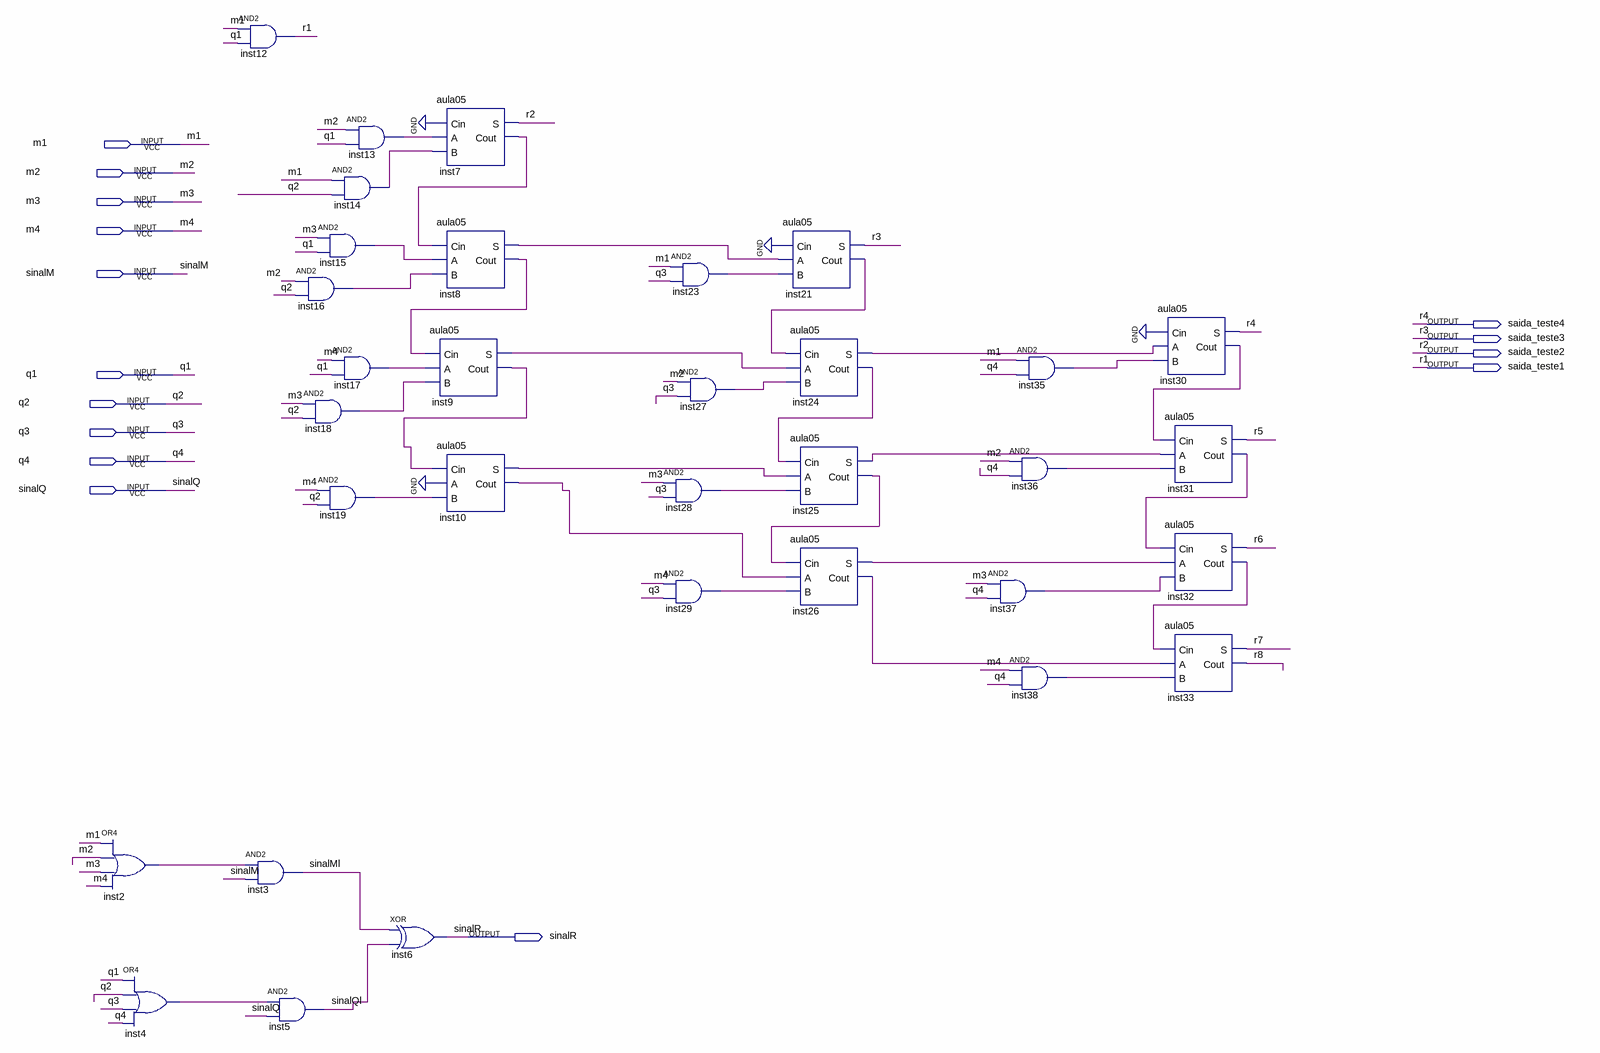
[diagram p0: schematic sheet]
// Quartus schematic aula10.bdf as structural Verilog: 33 symbols, 15 pins
module aula10 (
  input  m1,
  input  m2,
  input  m3,
  input  m4,
  input  sinalM,
  input  q1,
  input  q2,
  input  q3,
  input  q4,
  input  sinalQ,
  output saida_teste4,
  output saida_teste3,
  output saida_teste2,
  output saida_teste1,
  output sinalR
);

  wire inst2_out, inst4_out, inst7_cout, inst8_cout, inst8_s, inst9_cout, inst9_s, inst10_cout, inst10_s,
       inst13_out, inst14_out, inst15_out, inst16_out, inst17_out, inst18_out, inst19_out, inst21_cout,
       inst23_out, inst24_cout, inst24_s, inst25_cout, inst25_s, inst26_cout, inst26_s, inst27_out,
       inst28_out, inst29_out, inst30_cout, inst31_cout, inst32_cout, inst35_out, inst36_out, inst37_out,
       inst38_out, r5, r6, r7, r8, sinalMl, sinalQl;

  or inst2 (inst2_out, m1, m2, m3, m4);
  or inst4 (inst4_out, q1, q2, q3, q4);
  and inst12 (saida_teste1, m1, q1);
  and inst3 (sinalMl, inst2_out, sinalM);
  and inst5 (sinalQl, inst4_out, sinalQ);
  and inst13 (inst13_out, m2, q1);
  and inst14 (inst14_out, m1, q2);
  and inst15 (inst15_out, m3, q1);
  and inst16 (inst16_out, m2, q2);
  and inst17 (inst17_out, m4, q1);
  and inst18 (inst18_out, m3, q2);
  and inst19 (inst19_out, m4, q2);
  xor inst6 (sinalR, sinalMl, sinalQl);
  aula05 inst7 (.Cin(1'b0), .A(inst13_out), .B(inst14_out), .S(saida_teste2), .Cout(inst7_cout));
  aula05 inst8 (.Cin(inst7_cout), .A(inst15_out), .B(inst16_out), .S(inst8_s), .Cout(inst8_cout));
  aula05 inst9 (.Cin(inst8_cout), .A(inst17_out), .B(inst18_out), .S(inst9_s), .Cout(inst9_cout));
  aula05 inst10 (.Cin(inst9_cout), .A(1'b0), .B(inst19_out), .S(inst10_s), .Cout(inst10_cout));
  and inst23 (inst23_out, m1, q3);
  and inst27 (inst27_out, m2, q3);
  and inst28 (inst28_out, m3, q3);
  and inst29 (inst29_out, m4, q3);
  aula05 inst21 (.Cin(1'b0), .A(inst8_s), .B(inst23_out), .S(saida_teste3), .Cout(inst21_cout));
  aula05 inst24 (.Cin(inst21_cout), .A(inst9_s), .B(inst27_out), .S(inst24_s), .Cout(inst24_cout));
  aula05 inst25 (.Cin(inst24_cout), .A(inst10_s), .B(inst28_out), .S(inst25_s), .Cout(inst25_cout));
  aula05 inst26 (.Cin(inst25_cout), .A(inst10_cout), .B(inst29_out), .S(inst26_s), .Cout(inst26_cout));
  and inst35 (inst35_out, m1, q4);
  and inst36 (inst36_out, m2, q4);
  and inst37 (inst37_out, m3, q4);
  and inst38 (inst38_out, m4, q4);
  aula05 inst30 (.Cin(1'b0), .A(inst24_s), .B(inst35_out), .S(saida_teste4), .Cout(inst30_cout));
  aula05 inst31 (.Cin(inst30_cout), .A(inst25_s), .B(inst36_out), .S(r5), .Cout(inst31_cout));
  aula05 inst32 (.Cin(inst31_cout), .A(inst26_s), .B(inst37_out), .S(r6), .Cout(inst32_cout));
  aula05 inst33 (.Cin(inst32_cout), .A(inst26_cout), .B(inst38_out), .S(r7), .Cout(r8));

  // Other names for the same wires on the sheet: r1 = saida_teste1; r2 = saida_teste2; r3 = saida_teste3;
  //   r4 = saida_teste4
endmodule
